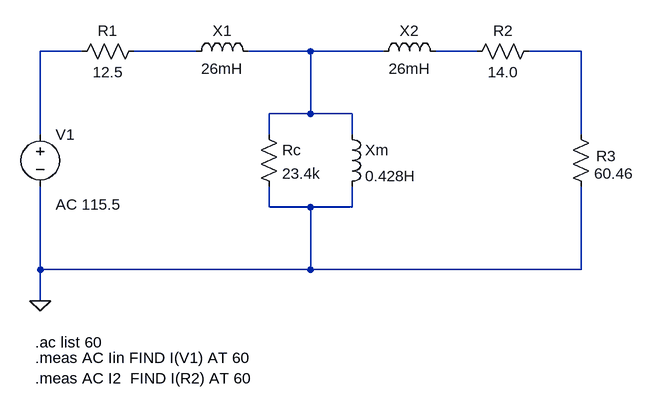
[diagram p0: schematic dc-motor-equiv-circuit.asc]
dc-motor-equiv-circuit.asc, the LTspice schematic file:
Version 4
SHEET 1 1300 680
WIRE 128 0 64 0
WIRE 304 0 208 0
WIRE 480 0 384 0
WIRE 592 0 480 0
WIRE 736 0 672 0
WIRE 896 0 816 0
WIRE 480 96 480 0
WIRE 480 96 416 96
WIRE 544 96 480 96
WIRE 64 128 64 0
WIRE 416 128 416 96
WIRE 544 128 544 96
WIRE 896 128 896 0
WIRE 416 240 416 208
WIRE 480 240 416 240
WIRE 544 240 544 208
WIRE 544 240 480 240
WIRE 64 336 64 208
WIRE 480 336 480 240
WIRE 480 336 64 336
WIRE 896 336 896 208
WIRE 896 336 480 336
WIRE 64 384 64 336
FLAG 64 384 0
SYMBOL voltage 64 112 R0
WINDOW 123 24 124 Left 2
WINDOW 39 0 0 Left 0
SYMATTR InstName V1
SYMATTR Value ""
SYMATTR Value2 AC 115.5
SYMBOL res 224 -16 R90
WINDOW 0 0 56 VBottom 2
WINDOW 3 32 56 VTop 2
SYMATTR InstName R1
SYMATTR Value 12.5
SYMBOL ind 400 16 M270
WINDOW 0 32 56 VTop 2
WINDOW 3 5 56 VBottom 2
SYMATTR InstName X1
SYMATTR Value 26mH
SYMBOL res 400 112 R0
SYMATTR InstName Rc
SYMATTR Value 23.4k
SYMBOL ind 528 112 R0
SYMATTR InstName Xm
SYMATTR Value 0.428H
SYMBOL ind 688 16 M270
WINDOW 0 32 56 VTop 2
WINDOW 3 5 56 VBottom 2
SYMATTR InstName X2
SYMATTR Value 26mH
SYMBOL res 832 -16 R90
WINDOW 0 0 56 VBottom 2
WINDOW 3 32 56 VTop 2
SYMATTR InstName R2
SYMATTR Value 14.0
SYMBOL res 880 112 R0
WINDOW 0 39 49 Left 2
SYMATTR InstName R3
SYMATTR Value 60.46
TEXT 56 448 Left 2 !.ac list 60
TEXT 56 472 Left 2 !.meas AC Iin FIND I(V1) AT 60\n.meas AC I2  FIND I(R2) AT 60

The netlist it stands for:
* dc-motor-equiv-circuit.asc
V1 N001 0 AC 115.5
R1 N002 N001 12.5
L§X1 N003 N002 26mH
Rc N003 0 23.4k
L§Xm N003 0 0.428H
L§X2 N004 N003 26mH
R2 N005 N004 14.0
R3 N005 0 60.46
.ac list 60
.meas AC Iin FIND I(V1) AT 60
.meas AC I2  FIND I(R2) AT 60
.backanno
.end